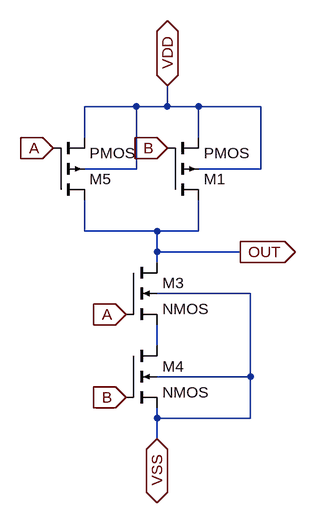
[diagram p0: schematic NAND2.asc]
NAND2.asc, the LTspice schematic file:
Version 4.1
SHEET 1 880 680
WIRE 160 -688 80 -688
WIRE 208 -688 208 -720
WIRE 208 -688 160 -688
WIRE 256 -688 208 -688
WIRE 352 -688 256 -688
WIRE 80 -640 80 -688
WIRE 256 -640 256 -688
WIRE 160 -592 160 -688
WIRE 160 -592 80 -592
WIRE 352 -592 352 -688
WIRE 352 -592 256 -592
WIRE 80 -496 80 -544
WIRE 192 -496 80 -496
WIRE 256 -496 256 -544
WIRE 256 -496 192 -496
WIRE 192 -464 192 -496
WIRE 320 -464 192 -464
WIRE 192 -448 192 -464
WIRE 336 -400 192 -400
WIRE 192 -320 192 -352
WIRE 336 -272 336 -400
WIRE 336 -272 192 -272
WIRE 192 -208 192 -224
WIRE 336 -208 336 -272
WIRE 336 -208 192 -208
WIRE 192 -176 192 -208
FLAG 208 -720 VDD
IOPIN 208 -720 BiDir
FLAG 192 -176 VSS
IOPIN 192 -176 BiDir
FLAG 32 -624 A
IOPIN 32 -624 In
FLAG 208 -624 B
IOPIN 208 -624 In
FLAG 144 -368 A
IOPIN 144 -368 In
FLAG 144 -240 B
IOPIN 144 -240 In
FLAG 320 -464 OUT
IOPIN 320 -464 Out
SYMBOL nmos4 144 -448 R0
SYMATTR InstName M3
SYMBOL nmos4 144 -320 R0
SYMATTR InstName M4
SYMBOL pmos4 32 -544 M180
SYMATTR InstName M5
SYMBOL pmos4 208 -544 M180
SYMATTR InstName M1

The netlist it stands for:
* NAND2.asc
M3 OUT A N001 VSS NMOS
M4 N001 B VSS VSS NMOS
M5 OUT A VDD VDD PMOS
M1 OUT B VDD VDD PMOS
.model NMOS NMOS
.model PMOS PMOS
.lib standard.mos
.backanno
.end